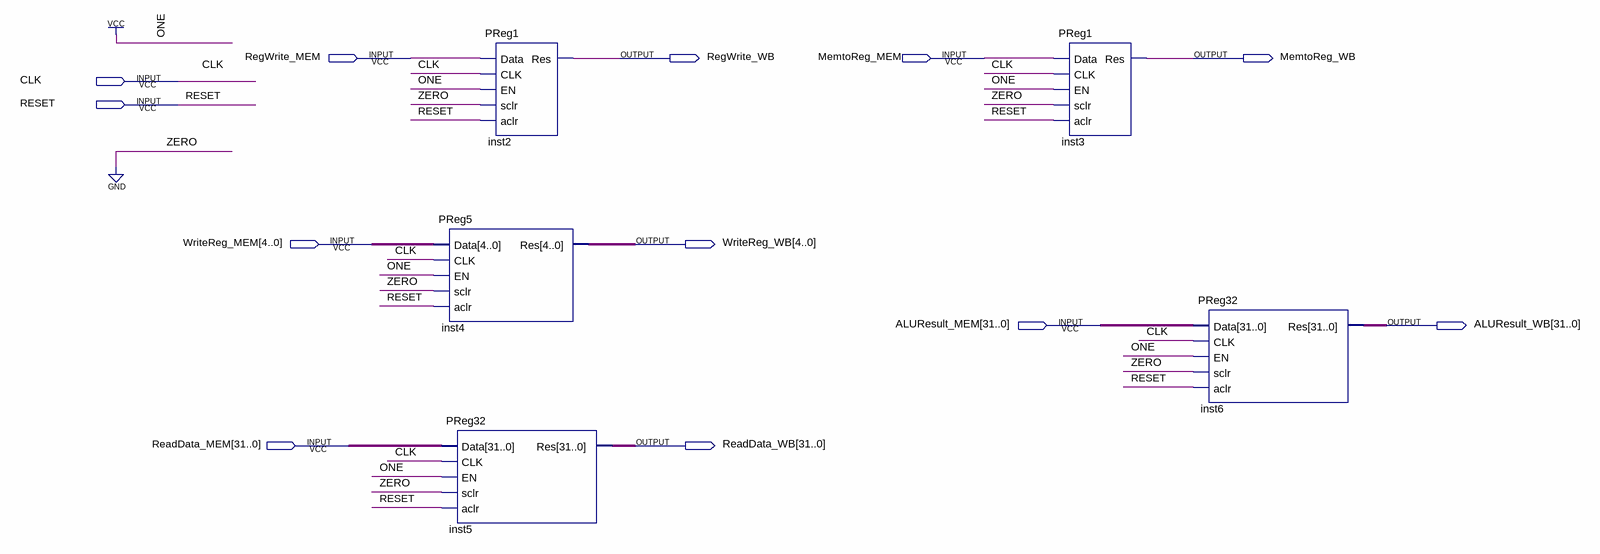
[diagram p0: schematic sheet]
// Quartus schematic MEM_WB.bdf as structural Verilog: 5 symbols, 12 pins
module MEM_WB (
  input  RegWrite_MEM,
  input  MemtoReg_MEM,
  input  CLK,
  input  RESET,
  input  [4:0] WriteReg_MEM,
  input  [31:0] ALUResult_MEM,
  input  [31:0] ReadData_MEM,
  output RegWrite_WB,
  output MemtoReg_WB,
  output [4:0] WriteReg_WB,
  output [31:0] ALUResult_WB,
  output [31:0] ReadData_WB
);

  PReg5 inst4 (.Data(WriteReg_MEM), .CLK(CLK), .EN(1'b1), .sclr(1'b0), .aclr(RESET), .Res(WriteReg_WB));
  PReg32 inst5 (.Data(ReadData_MEM), .CLK(CLK), .EN(1'b1), .sclr(1'b0), .aclr(RESET), .Res(ReadData_WB));
  PReg1 inst2 (.Data(RegWrite_MEM), .CLK(CLK), .EN(1'b1), .sclr(1'b0), .aclr(RESET), .Res(RegWrite_WB));
  PReg1 inst3 (.Data(MemtoReg_MEM), .CLK(CLK), .EN(1'b1), .sclr(1'b0), .aclr(RESET), .Res(MemtoReg_WB));
  PReg32 inst6 (.Data(ALUResult_MEM), .CLK(CLK), .EN(1'b1), .sclr(1'b0), .aclr(RESET), .Res(ALUResult_WB));
endmodule
